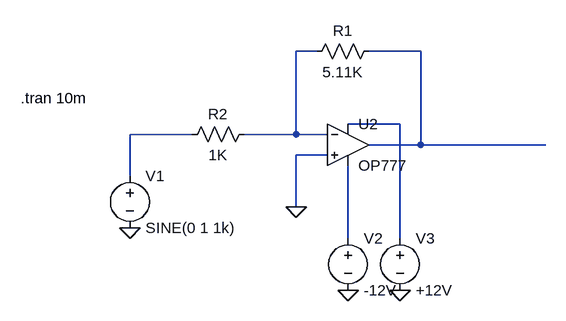
[diagram p0: schematic inverting1.asc]
inverting1.asc, the LTspice schematic file:
Version 4.1
SHEET 1 880 680
WIRE 144 -16 112 -16
WIRE 304 -16 224 -16
WIRE 272 96 192 96
WIRE -48 112 -144 112
WIRE 112 112 112 -16
WIRE 112 112 32 112
WIRE 160 112 112 112
WIRE 304 128 304 -16
WIRE 304 128 224 128
WIRE 496 128 304 128
WIRE 160 144 112 144
WIRE -144 176 -144 112
WIRE 112 224 112 144
WIRE 192 272 192 160
WIRE 272 272 272 96
FLAG -144 256 0
FLAG 112 224 0
FLAG 192 352 0
FLAG 272 352 0
SYMBOL res 240 -32 R90
WINDOW 0 0 56 VBottom 2
WINDOW 3 32 56 VTop 2
SYMATTR InstName R1
SYMATTR Value 5.11K
SYMATTR SpiceLine tol=1 pwr=0.1
SYMBOL res 48 96 R90
WINDOW 0 0 56 VBottom 2
WINDOW 3 32 56 VTop 2
SYMATTR InstName R2
SYMATTR Value 1K
SYMATTR SpiceLine tol=1 pwr=0.1
SYMBOL voltage -144 160 R0
WINDOW 123 0 0 Left 0
WINDOW 39 0 0 Left 0
SYMATTR InstName V1
SYMATTR Value SINE(0 1 1k)
SYMBOL voltage 192 256 R0
WINDOW 123 0 0 Left 0
WINDOW 39 0 0 Left 0
SYMATTR InstName V2
SYMATTR Value -12V
SYMBOL voltage 272 256 R0
WINDOW 123 0 0 Left 0
WINDOW 39 0 0 Left 0
SYMATTR InstName V3
SYMATTR Value +12V
SYMBOL OpAmps\\OP777 192 64 R0
SYMATTR InstName U2
TEXT -312 56 Left 2 !.tran 10m

The netlist it stands for:
* inverting1.asc
R1 N002 N001 5.11K tol=1 pwr=0.1
R2 N001 N004 1K tol=1 pwr=0.1
V1 N004 0 SINE(0 1 1k)
V2 N005 0 -12V
V3 N003 0 +12V
X§U2 0 N001 N003 N005 N002 OP777  ; pins In+ In- V+ V- OUT
.tran 10m
.lib ADI.lib
.backanno
.end